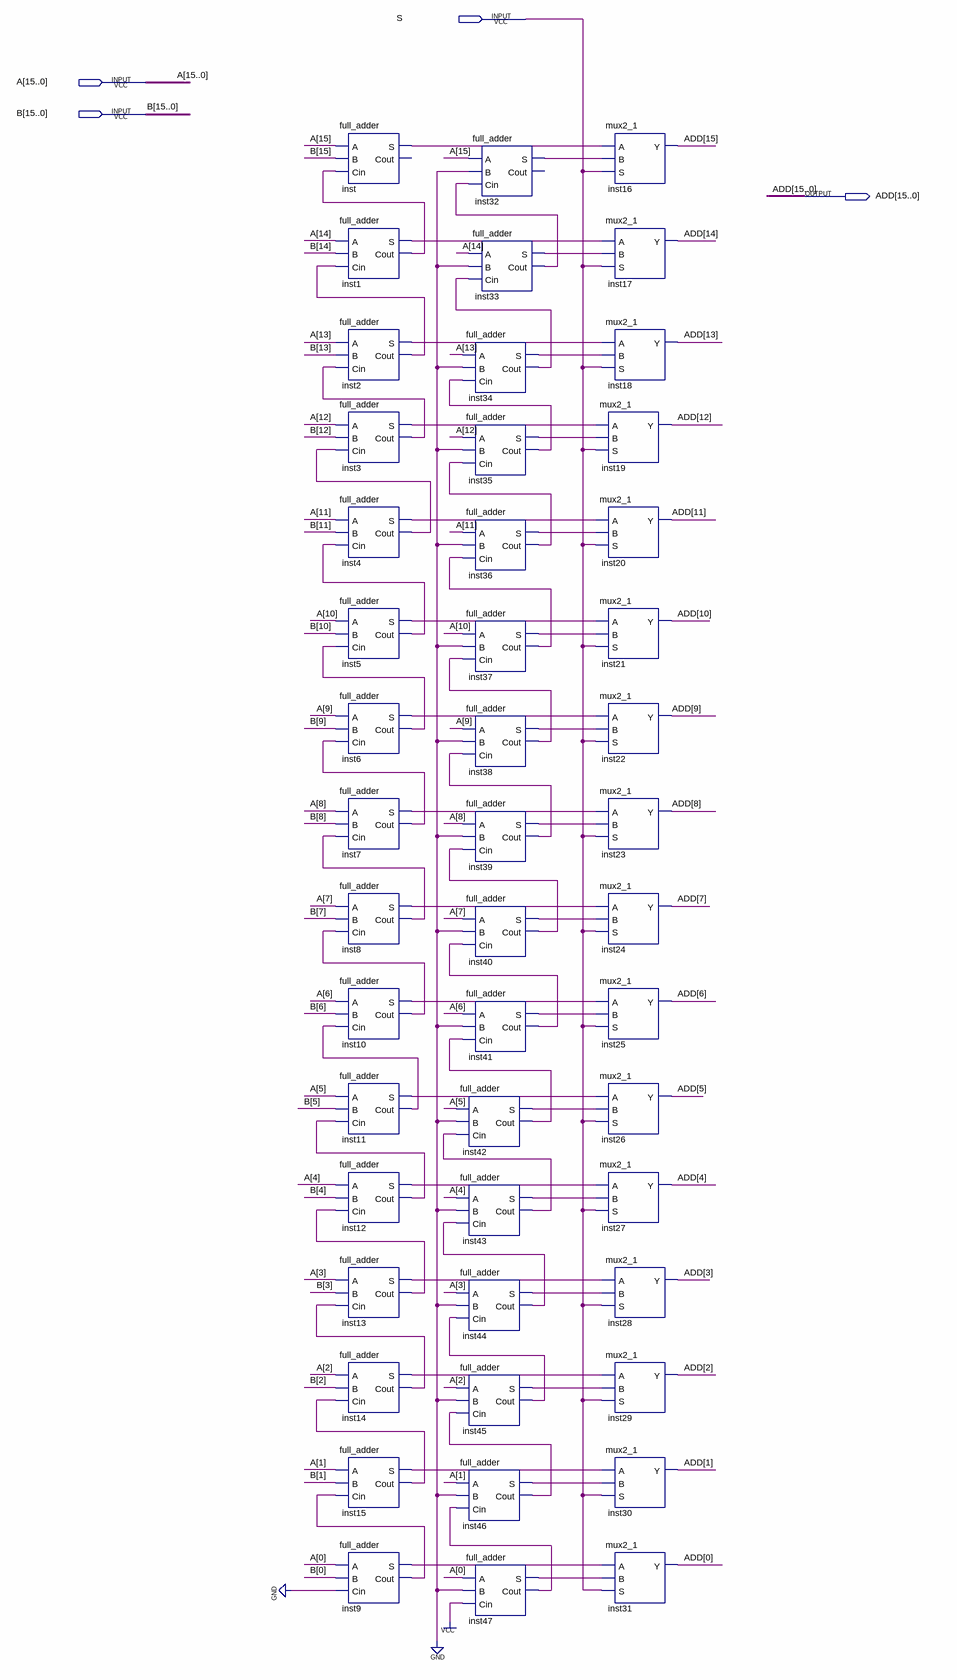
[diagram p0: schematic sheet]
// Quartus schematic full_adder_16bit.bdf as structural Verilog: 48 symbols, 4 pins
module full_adder_16bit (
  input  S,
  input  [15:0] A,
  input  [15:0] B,
  output [15:0] ADD
);

  wire inst1_cout, inst1_s, inst2_cout, inst2_s, inst3_cout, inst3_s, inst4_cout, inst4_s, inst5_cout,
       inst5_s, inst6_cout, inst6_s, inst7_cout, inst7_s, inst8_cout, inst8_s, inst9_cout, inst9_s,
       inst10_cout, inst10_s, inst11_cout, inst11_s, inst12_cout, inst12_s, inst13_cout, inst13_s,
       inst14_cout, inst14_s, inst15_cout, inst15_s, inst32_s, inst33_cout, inst33_s, inst34_cout, inst34_s,
       inst35_cout, inst35_s, inst36_cout, inst36_s, inst37_cout, inst37_s, inst38_cout, inst38_s,
       inst39_cout, inst39_s, inst40_cout, inst40_s, inst41_cout, inst41_s, inst42_cout, inst42_s,
       inst43_cout, inst43_s, inst44_cout, inst44_s, inst45_cout, inst45_s, inst46_cout, inst46_s,
       inst47_cout, inst47_s, inst_s;

  full_adder inst (.A(A[15]), .B(B[15]), .Cin(inst1_cout), .S(inst_s));  // open: Cout
  full_adder inst1 (.A(A[14]), .B(B[14]), .Cin(inst2_cout), .S(inst1_s), .Cout(inst1_cout));
  full_adder inst2 (.A(A[13]), .B(B[13]), .Cin(inst3_cout), .S(inst2_s), .Cout(inst2_cout));
  full_adder inst3 (.A(A[12]), .B(B[12]), .Cin(inst4_cout), .S(inst3_s), .Cout(inst3_cout));
  full_adder inst4 (.A(A[11]), .B(B[11]), .Cin(inst5_cout), .S(inst4_s), .Cout(inst4_cout));
  full_adder inst5 (.A(A[10]), .B(B[10]), .Cin(inst6_cout), .S(inst5_s), .Cout(inst5_cout));
  full_adder inst6 (.A(A[9]), .B(B[9]), .Cin(inst7_cout), .S(inst6_s), .Cout(inst6_cout));
  full_adder inst7 (.A(A[8]), .B(B[8]), .Cin(inst8_cout), .S(inst7_s), .Cout(inst7_cout));
  full_adder inst8 (.A(A[7]), .B(B[7]), .Cin(inst10_cout), .S(inst8_s), .Cout(inst8_cout));
  full_adder inst10 (.A(A[6]), .B(B[6]), .Cin(inst11_cout), .S(inst10_s), .Cout(inst10_cout));
  full_adder inst11 (.A(A[5]), .B(B[5]), .Cin(inst12_cout), .S(inst11_s), .Cout(inst11_cout));
  full_adder inst12 (.A(A[4]), .B(B[4]), .Cin(inst13_cout), .S(inst12_s), .Cout(inst12_cout));
  full_adder inst13 (.A(A[3]), .B(B[3]), .Cin(inst14_cout), .S(inst13_s), .Cout(inst13_cout));
  full_adder inst14 (.A(A[2]), .B(B[2]), .Cin(inst15_cout), .S(inst14_s), .Cout(inst14_cout));
  full_adder inst15 (.A(A[1]), .B(B[1]), .Cin(inst9_cout), .S(inst15_s), .Cout(inst15_cout));
  full_adder inst9 (.A(A[0]), .B(B[0]), .Cin(1'b0), .S(inst9_s), .Cout(inst9_cout));
  full_adder inst32 (.A(A[15]), .B(1'b0), .Cin(inst33_cout), .S(inst32_s));  // open: Cout
  full_adder inst33 (.A(A[14]), .B(1'b0), .Cin(inst34_cout), .S(inst33_s), .Cout(inst33_cout));
  full_adder inst34 (.A(A[13]), .B(1'b0), .Cin(inst35_cout), .S(inst34_s), .Cout(inst34_cout));
  full_adder inst35 (.A(A[12]), .B(1'b0), .Cin(inst36_cout), .S(inst35_s), .Cout(inst35_cout));
  full_adder inst36 (.A(A[11]), .B(1'b0), .Cin(inst37_cout), .S(inst36_s), .Cout(inst36_cout));
  full_adder inst37 (.A(A[10]), .B(1'b0), .Cin(inst38_cout), .S(inst37_s), .Cout(inst37_cout));
  full_adder inst38 (.A(A[9]), .B(1'b0), .Cin(inst39_cout), .S(inst38_s), .Cout(inst38_cout));
  full_adder inst39 (.A(A[8]), .B(1'b0), .Cin(inst40_cout), .S(inst39_s), .Cout(inst39_cout));
  full_adder inst40 (.A(A[7]), .B(1'b0), .Cin(inst41_cout), .S(inst40_s), .Cout(inst40_cout));
  full_adder inst41 (.A(A[6]), .B(1'b0), .Cin(inst42_cout), .S(inst41_s), .Cout(inst41_cout));
  full_adder inst42 (.A(A[5]), .B(1'b0), .Cin(inst43_cout), .S(inst42_s), .Cout(inst42_cout));
  full_adder inst43 (.A(A[4]), .B(1'b0), .Cin(inst44_cout), .S(inst43_s), .Cout(inst43_cout));
  full_adder inst44 (.A(A[3]), .B(1'b0), .Cin(inst45_cout), .S(inst44_s), .Cout(inst44_cout));
  full_adder inst45 (.A(A[2]), .B(1'b0), .Cin(inst46_cout), .S(inst45_s), .Cout(inst45_cout));
  full_adder inst46 (.A(A[1]), .B(1'b0), .Cin(inst47_cout), .S(inst46_s), .Cout(inst46_cout));
  full_adder inst47 (.A(A[0]), .B(1'b0), .Cin(1'b1), .S(inst47_s), .Cout(inst47_cout));
  mux2_1 inst16 (.A(inst_s), .B(inst32_s), .S(S), .Y(ADD[15]));
  mux2_1 inst17 (.A(inst1_s), .B(inst33_s), .S(S), .Y(ADD[14]));
  mux2_1 inst18 (.A(inst2_s), .B(inst34_s), .S(S), .Y(ADD[13]));
  mux2_1 inst19 (.A(inst3_s), .B(inst35_s), .S(S), .Y(ADD[12]));
  mux2_1 inst20 (.A(inst4_s), .B(inst36_s), .S(S), .Y(ADD[11]));
  mux2_1 inst21 (.A(inst5_s), .B(inst37_s), .S(S), .Y(ADD[10]));
  mux2_1 inst22 (.A(inst6_s), .B(inst38_s), .S(S), .Y(ADD[9]));
  mux2_1 inst23 (.A(inst7_s), .B(inst39_s), .S(S), .Y(ADD[8]));
  mux2_1 inst24 (.A(inst8_s), .B(inst40_s), .S(S), .Y(ADD[7]));
  mux2_1 inst25 (.A(inst10_s), .B(inst41_s), .S(S), .Y(ADD[6]));
  mux2_1 inst26 (.A(inst11_s), .B(inst42_s), .S(S), .Y(ADD[5]));
  mux2_1 inst27 (.A(inst12_s), .B(inst43_s), .S(S), .Y(ADD[4]));
  mux2_1 inst28 (.A(inst13_s), .B(inst44_s), .S(S), .Y(ADD[3]));
  mux2_1 inst29 (.A(inst14_s), .B(inst45_s), .S(S), .Y(ADD[2]));
  mux2_1 inst30 (.A(inst15_s), .B(inst46_s), .S(S), .Y(ADD[1]));
  mux2_1 inst31 (.A(inst9_s), .B(inst47_s), .S(S), .Y(ADD[0]));
endmodule
